# Altium schematic sheet 12V Buck.SchDoc
size B; SheetNumber: 3; SheetTotal: 7
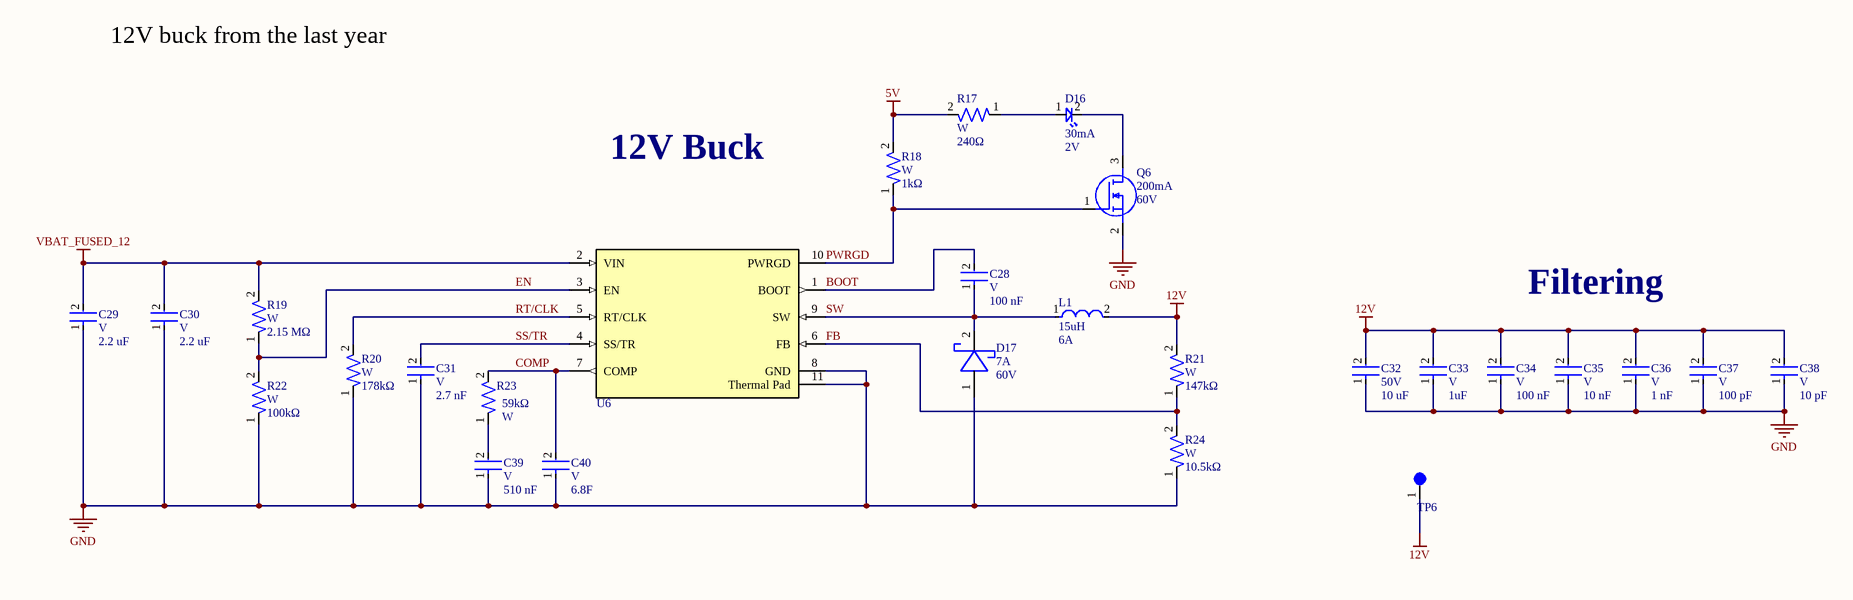
[diagram p0: 12V Buck.SchDoc]

## Parts
C28  Voltage Rating: V  Capacitance: 100 nF  [CAP-0805]  (hidden comment: CL21B104KBCNNNC)
C29  Voltage Rating: V  Capacitance: 2.2 uF  [CAP-0805]  (hidden comment: CL21A225KBFNNNE)
C30  Voltage Rating: V  Capacitance: 2.2 uF  [CAP-0805]  (hidden comment: CL21A225KBFNNNE)
C31  Voltage Rating: V  Capacitance: 2.7 nF  [CAP-0805]  (hidden comment: CAP 0805)
C32  Voltage Rating: 50V  Capacitance: 10 uF  [CAP-1210]  (hidden comment: CL32B106KMVNNWE)
C33  Voltage Rating: V  Capacitance: 1uF  [CAP-0805]  (hidden comment: CC0805JKX7R9BB105)
C34  Voltage Rating: V  Capacitance: 100 nF  [CAP-0805]  (hidden comment: CL21B104KBCNNNC)
C35  Voltage Rating: V  Capacitance: 10 nF  [CAP-0805]  (hidden comment: C0805C103K5RACTU)
C36  Voltage Rating: V  Capacitance: 1 nF  [CAP-0805]  (hidden comment: CL21B102KBANNNC)
C37  Voltage Rating: V  Capacitance: 100 pF  [CAP-0805]  (hidden comment: CL21C101JBANNNC)
C38  Voltage Rating: V  Capacitance: 10 pF  [CAP-0805]  (hidden comment: CL21C100CBANNNC)
C39  Voltage Rating: V  Capacitance: 510 nF  [CAP-0603]  (hidden comment: GRM1885C1H511JA01D)
C40  Voltage Rating: V  Capacitance: 6.8F  [CAP-0603]  (hidden comment: CL10C6R8CB8NNNC)
D16  Forward Current: 30mA  Forward Voltage: 2V  [LED-0603]  (hidden comment: BL-HKC36G-AV-TRB)
D17  Forward Current: 7A  Reverse Voltage (DC): 60V  [DO-POWERDI5]  (hidden comment: PDS760-13)
L1  Inductance: 15uH  Current Rating: 6A  [IND-15U-0002]  (hidden comment: CSAD1010-150M)
Q6  Continuous Current: 200mA  Voltage: 60V  [IC-SOT23-3]  (hidden comment: T2N7002AK,LM)
R17  Wattage: W  Resistance: 240Ω  [RES-0805]  (hidden comment: ERJ-6GEYJ241V)
R18  Wattage: W  Resistance: 1kΩ  [RES-0805]  (hidden comment: CRCW08051K00FKEA)
R19  Wattage: W  Resistance: 2.15 MΩ  [RES-0805]  (hidden comment: CRCW08052M15FKEA)
R20  Wattage: W  Resistance: 178kΩ  [RES-0805]  (hidden comment: RC0805FR-07178KL)
R21  Wattage: W  Resistance: 147kΩ  [RES-0805]  (hidden comment: RC0805FR-07147KL)
R22  Wattage: W  Resistance: 100kΩ  [RES-0805]  (hidden comment: ERA-6AEB104V)
R23  Wattage: W  Resistance: 59kΩ  [RES-0603]  (hidden comment: RC0603FR-0759KL)
R24  Wattage: W  Resistance: 10.5kΩ  [RES-0805]  (hidden comment: RC0805FR-0710K5L)
TP6  5003  [TEST-POINT-0001]  (value not drawn)
U6  TPS54561DPRR  [IC-10WSON]  (value not drawn)

## Nets
5V: R17.2 R18.2
12V: C32.2 C33.2 C34.2 C35.2 C36.2 C37.2 C38.2 L1.2 R21.2 TP6.1
GND: C29.1 C30.1 C31.1 C32.1 C33.1 C34.1 C35.1 C36.1 C37.1 C38.1 C39.1 C40.1 D17.1(CATHODE) Q6.2(S) R20.1 R22.1 R24.1 U6.8(GND) U6.11(Thermal_Pad)
VBAT_FUSED_12: C29.2 C30.2 R19.2 U6.2(VIN)
BOOT: C28.2 U6.1(BOOT)
COMP: C40.2 R23.2 U6.7(COMP)
EN: R19.1 R22.2 U6.3(EN)
FB: R21.1 R24.2 U6.6(FB)
PWRGD: Q6.1(G) R18.1 U6.10(PWRGD)
RT/CLK: R20.2 U6.5(RT/CLK)
SS/TR: C31.2 U6.4(SS/TR)
SW: C28.1 D17.2(ANODE) L1.1 U6.9(SW)
NetC39_2: C39.2 R23.1
NetD16_1: D16.1 R17.1
NetD16_2: D16.2 Q6.3(D)

## Notes on the sheet
- 12V buck from the last year
- 12V Buck
- Filtering

## Library data of the parts
C28-C30 C33-C38 = CAP 0805
C32 = CAP 1210
C39 C40 = CAP 0603
D16 = LED-0001: LED YELLOW CLEAR 0603 SMD; ComponentLink1Description: Datasheet; ComponentLink1URL: https://www.americanbrightled.com/pdffiles/led-components/smt/BL-HKC36G-AV-TRB.pdf
D17 = DIO-SCHOTTKY-0001: DIODE SCHOTTKY 60V 7A POWERDI5; ComponentLink1Description: Datasheet; ComponentLink1URL: https://www.diodes.com/assets/Datasheets/PDS760.pdf
L1 = IND-15U-0002-NoJLC: SMD MOLDING POWER CHOKE; ComponentLink1Description: Datasheet; ComponentLink1URL: https://www.digikey.com/en/products/detail/codaca/CSAD1010-150M/16633512?s=N4IgjCBcoBwAxVAYygMwIYBsDOBTANCAPZQDaIALHAExwDMEAuoQA4AuUIAymwE4CWAOwDmIAL6Ew1MAE5EIFJAw4CxMiGoy6AdmoUQhajGqa6BjTDp6zhywFY4c23UtOLFbVXPVtYK3e9dODsbdwA2OxgQZhB2Th4BEXFJTQhoBTQsPEISSHITS0do1g5Ibj4hUQkNOBhteTiygFVBfjYAeVQAWVx0bABXXlxzfs4AVoAJcwBbIU4wAMJp9AAPeYDq2hgo9MaQFrbOnr7B4cJRsoBBGbmyuwA6DcIAWmp5RT5%2B1VzyAMYxAFAA
Q6 = NMOS-200MA-0001: MOSFET N-CH 60V 200MA SOT23; ComponentLink1Description: Datasheet; ComponentLink1URL: https://toshiba.semicon-storage.com/info/T2N7002AK_datasheet_en_20150401.pdf?did=29712&prodName=T2N7002AK
R17-R22 R24 = RES 0805
R23 = RES 0603
TP6 = TEST-POINT-0001: Oranange PC Test Point, Miniature Phoisphor Bronze Silver Plating Through Hole Mounting Type
U6 = IC-BUCK-0001: IC REG BUCK ADJ 5A 10WSON; ComponentLink1Description: Datasheet; ComponentLink1URL: https://www.ti.com/general/docs/suppproductinfo.tsp?distId=10&gotoUrl=https%3A%2F%2Fwww.ti.com%2Flit%2Fgpn%2Ftps54561